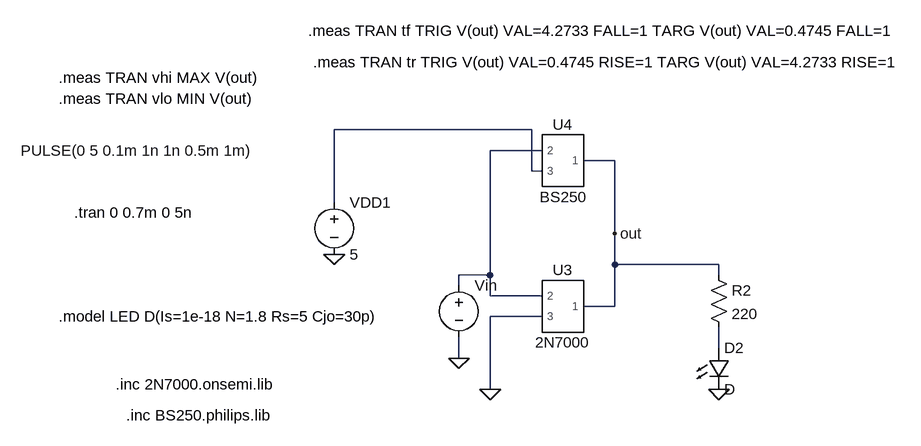
[diagram p0: schematic s7.asc]
s7.asc, the LTspice schematic file:
Version 4.1
SHEET 1 996 680
WIRE 304 128 0 128
WIRE 320 160 240 160
WIRE 432 176 384 176
WIRE 304 192 304 128
WIRE 320 192 304 192
WIRE 0 240 0 128
WIRE 432 288 432 176
WIRE 432 336 432 288
WIRE 592 336 432 336
WIRE 240 352 240 160
WIRE 240 352 192 352
WIRE 592 352 592 336
WIRE 192 368 192 352
WIRE 240 384 240 352
WIRE 320 384 240 384
WIRE 432 400 432 336
WIRE 432 400 384 400
WIRE 320 416 240 416
WIRE 592 464 592 432
WIRE 192 480 192 448
WIRE 240 528 240 416
FLAG 240 528 0
FLAG 0 320 0
FLAG 432 288 out
FLAG 592 528 0
FLAG 192 480 0
SYMBOL 2N7000 352 400 M0
SYMATTR InstName U3
SYMBOL BS250 352 176 M0
SYMATTR InstName U4
SYMBOL voltage 0 224 R0
WINDOW 123 0 0 Left 0
WINDOW 39 0 0 Left 0
SYMATTR InstName VDD1
SYMATTR Value 5
SYMBOL res 576 336 R0
SYMATTR InstName R2
SYMATTR Value 220
SYMBOL LED 576 464 R0
SYMATTR InstName D2
SYMBOL voltage 192 352 R0
WINDOW 3 -674 -192 Left 2
WINDOW 123 0 0 Left 0
WINDOW 39 0 0 Left 0
SYMATTR InstName Vin
SYMATTR Value PULSE(0 5 0.1m 1n 1n 0.5m 1m)
TEXT -320 568 Left 2 !.inc BS250.philips.lib
TEXT -336 520 Left 2 !.inc 2N7000.onsemi.lib
TEXT -424 416 Left 2 !.model LED D(Is=1e-18 N=1.8 Rs=5 Cjo=30p)
TEXT -424 48 Left 2 !.meas TRAN vhi MAX V(out)
TEXT -424 80 Left 2 !.meas TRAN vlo MIN V(out)
TEXT -40 -24 Left 2 !.meas TRAN tf TRIG V(out) VAL=4.2733 FALL=1 TARG V(out) VAL=0.4745 FALL=1
TEXT -32 24 Left 2 !.meas TRAN tr TRIG V(out) VAL=0.4745 RISE=1 TARG V(out) VAL=4.2733 RISE=1
TEXT -400 256 Left 2 !.tran 0 0.7m 0 5n

The netlist it stands for:
* s7.asc
X§U3 out N002 0 2N7000  ; pins 1 2 3
X§U4 out N002 N001 BS250  ; pins 1 2 3
VDD1 N001 0 5
R2 out N003 220
D2 N003 0 D
Vin N002 0 PULSE(0 5 0.1m 1n 1n 0.5m 1m)
.model D D
.lib standard.dio
.inc BS250.philips.lib
.inc 2N7000.onsemi.lib
.model LED D(Is=1e-18 N=1.8 Rs=5 Cjo=30p)
.meas TRAN vhi MAX V(out)
.meas TRAN vlo MIN V(out)
.meas TRAN tf TRIG V(out) VAL=4.2733 FALL=1 TARG V(out) VAL=0.4745 FALL=1
.meas TRAN tr TRIG V(out) VAL=0.4745 RISE=1 TARG V(out) VAL=4.2733 RISE=1
.tran 0 0.7m 0 5n
.lib 2N7000.onsemi.lib
.lib BS250.philips.lib
.backanno
.end